# Altium schematic sheet Pico.SchDoc: Mass Storage
size A; SheetNumber: 4; SheetTotal: 7
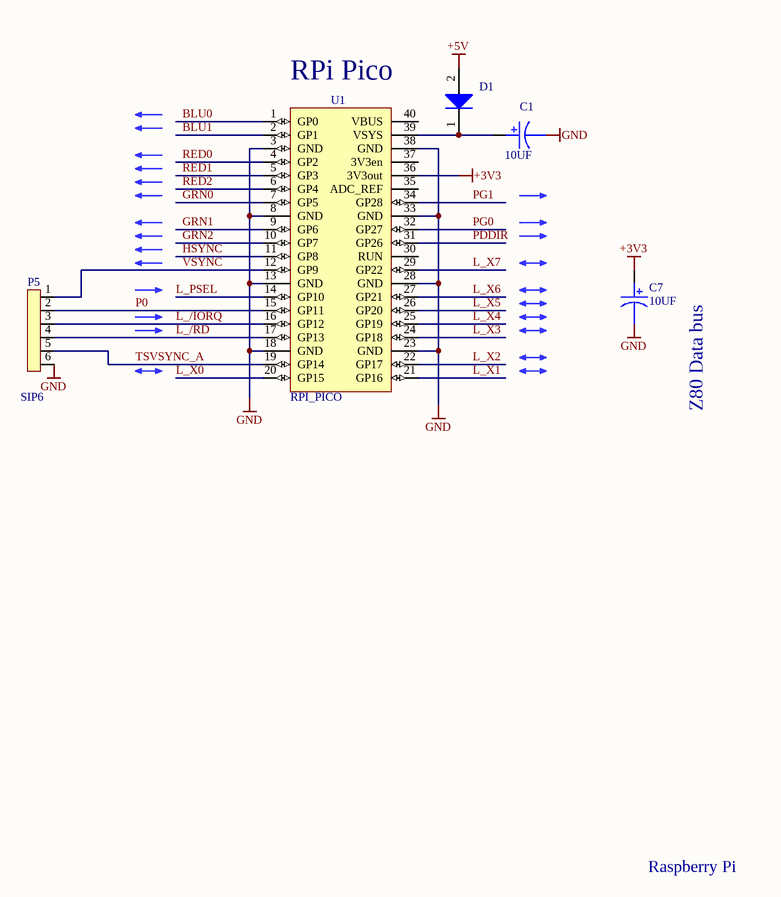
[diagram p0: Pico.SchDoc]

## Parts
C1  10UF  [CAP10EL]
C7  10UF  [CAP10EL]
D1  SB260_R2_00001  [DO-15]  (value not drawn)
P5  SIP6  [SIP6]
U1  RPI_PICO  [RPIPICO]

## Nets
+3V3: C7.1 U1.36(3V3out)
+5V: D1.2(A)
GND: C1.2 C7.2 P5.6 U1.3(GND) U1.8(GND) U1.13(GND) U1.18(GND) U1.23(GND) U1.28(GND) U1.33(GND) U1.38(GND)
BLU0: U1.1(GP0)
BLU1: U1.2(GP1)
GRN0: U1.7(GP5)
GRN1: U1.9(GP6)
GRN2: U1.10(GP7)
HSYNC: U1.11(GP8)
L_/IORQ: P5.3 U1.16(GP12)
L_/RD: P5.4 U1.17(GP13)
L_PSEL: U1.14(GP10)
L_X0: U1.20(GP15)
L_X1: U1.21(GP16)
L_X2: U1.22(GP17)
L_X3: U1.24(GP18)
L_X4: U1.25(GP19)
L_X5: U1.26(GP20)
L_X6: U1.27(GP21)
L_X7: U1.29(GP22)
P0: P5.2 U1.15(GP11)
PDDIR: U1.31(GP26)
PG0: U1.32(GP27)
PG1: U1.34(GP28)
RED0: U1.4(GP2)
RED1: U1.5(GP3)
RED2: U1.6(GP4)
TSVSYNC_A: P5.5 U1.19(GP14)
VSYNC: P5.1 U1.12(GP9)
NetC1_1: C1.1 D1.1 U1.39(VSYS)

Not connected (* = marked no-connect by the designer): U1 30(RUN) 35(ADC_REF) 37(3V3en) 40(VBUS)

## Notes on the sheet
- RPi Pico
- (near C7) Z80 Data bus
- Raspberry Pi

## Library data of the parts
C1 C7 = 10UF: CAP ALUM 10UF 20% 16V RADIAL; MFG: Panasonic; MFG PN: ECE-A1CKA100; DK PN: P807-ND
D1 = SB260_R2_00001: DIODE SCHOTTKY 60V 2A DO15; DK PN: 3757-SB260_R2_00001CT-ND; MFG: Panjit; MFG PN: SB260_R2_00001; FOOTPRINT: DO15; Populate: *
U1 = RPI_PICO: RASPBERRY PI PICO RP2040 BOARD; MFG PN: SC0915; DK PN: 2648-SC0915CT-ND; MFG: Raspberry Pi; Populate: *